# Altium schematic sheet 10_HDMI.SchDoc
size 812 x 508 mm; SheetNumber: 10; SheetTotal: 16
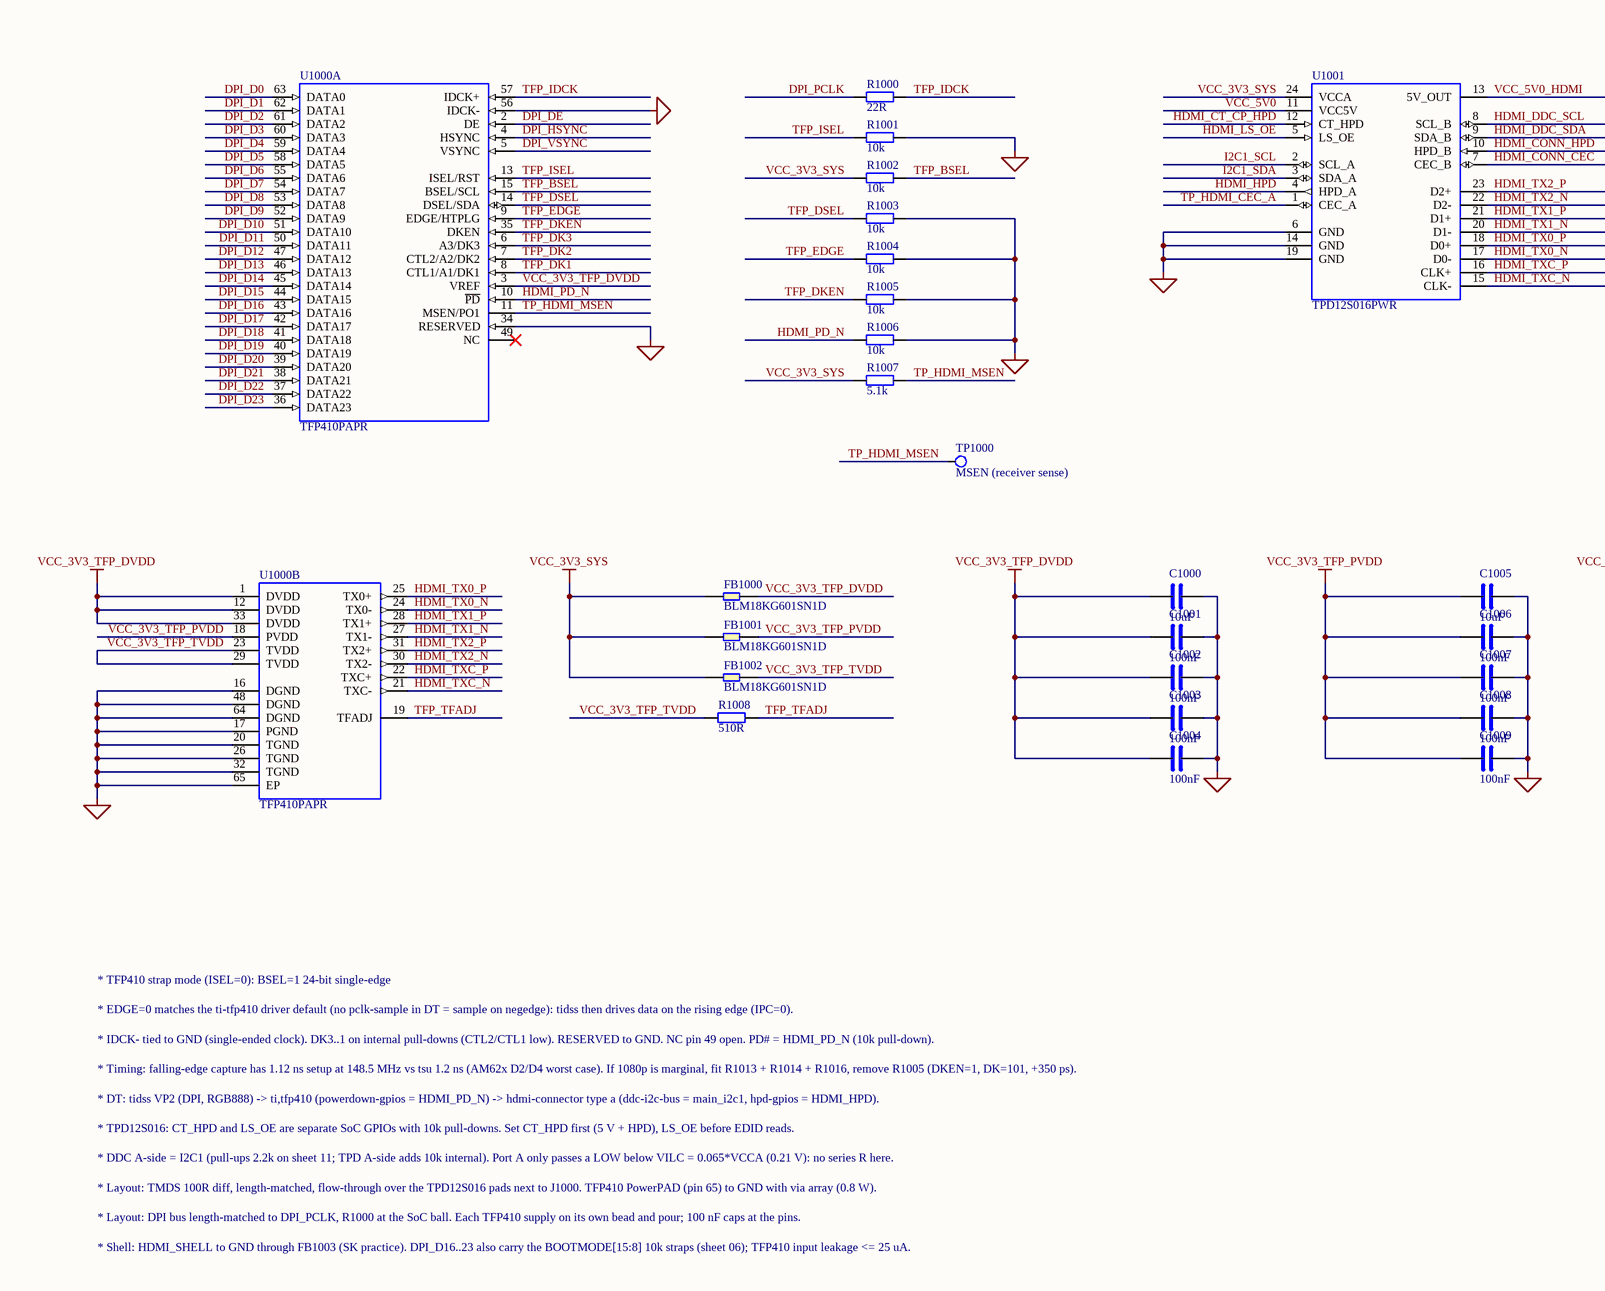
[diagram p0: 10_HDMI.SchDoc, left]
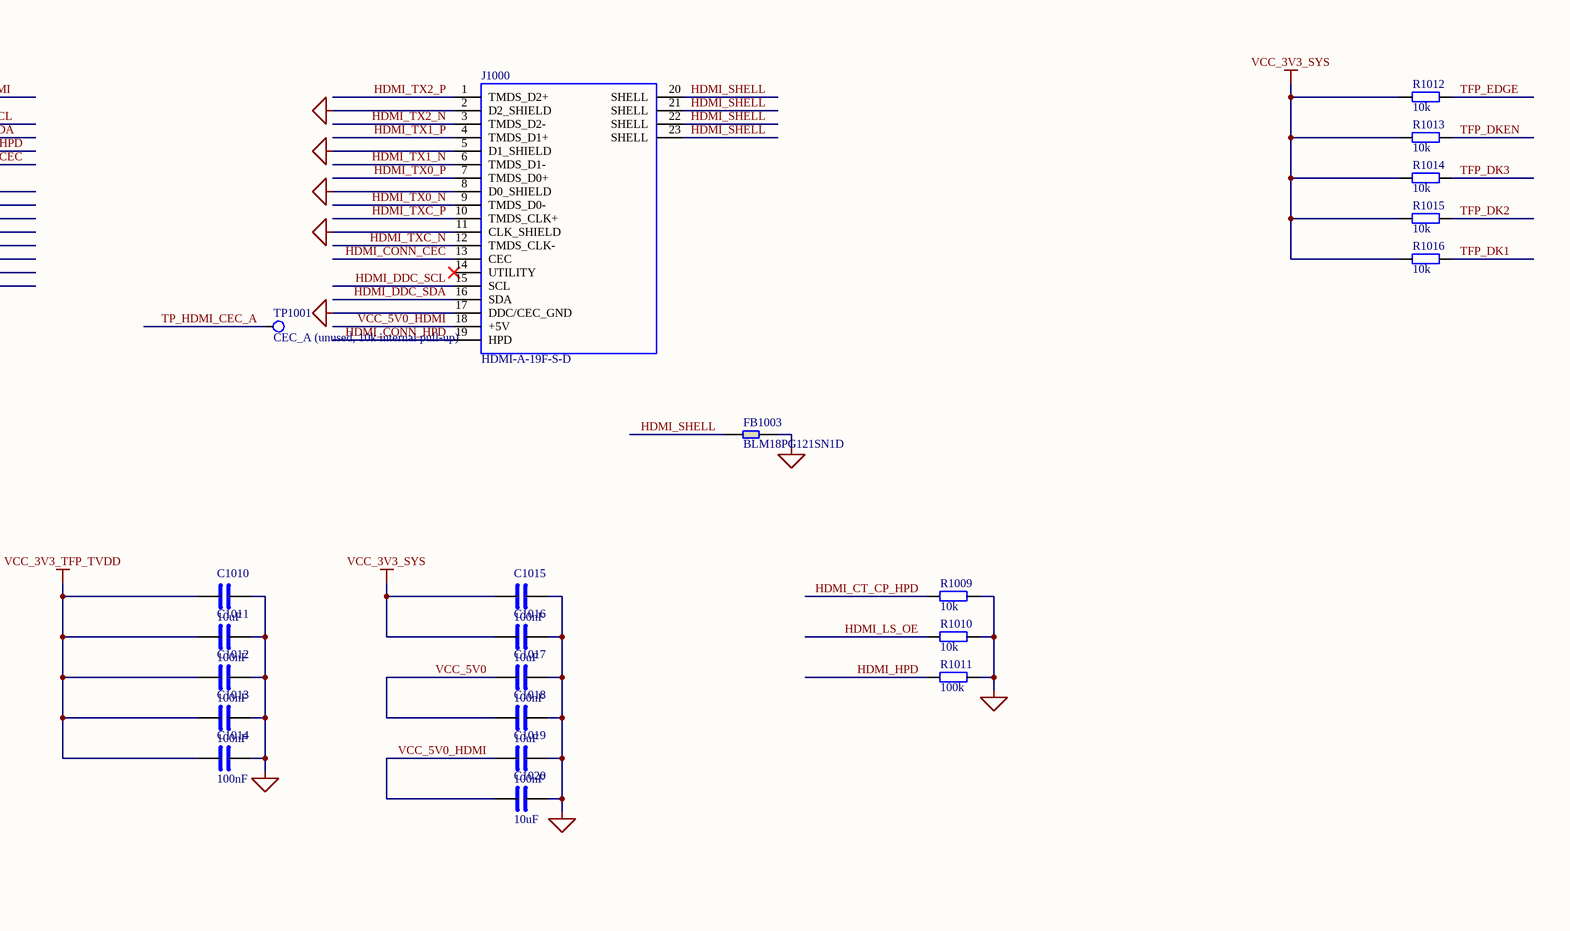
[diagram p1: 10_HDMI.SchDoc, right]

## Parts
C1000  10uF  [C0603]
C1001  100nF  [C0402]
C1002  100nF  [C0402]
C1003  100nF  [C0402]
C1004  100nF  [C0402]
C1005  10uF  [C0603]
C1006  100nF  [C0402]
C1007  100nF  [C0402]
C1008  100nF  [C0402]
C1009  100nF  [C0402]
C1010  10uF  [C0603]
C1011  100nF  [C0402]
C1012  100nF  [C0402]
C1013  100nF  [C0402]
C1014  100nF  [C0402]
C1015  100nF  [C0402]
C1016  10uF  [C0603]
C1017  100nF  [C0402]
C1018  10uF  [C0603]
C1019  100nF  [C0402]
C1020  10uF  [C0603]
FB1000  BLM18KG601SN1D  [FB0603]
FB1001  BLM18KG601SN1D  [FB0603]
FB1002  BLM18KG601SN1D  [FB0603]
FB1003  BLM18PG121SN1D  [FB0603]
J1000  HDMI-A-19F-S-D  [HDMI_A_XFCN_19F_S_D]
R1000  22R  [R0402]
R1001  10k  [R0402]
R1002  10k  [R0402]
R1003  10k  [R0402]
R1004  10k  [R0402]
R1005  10k  [R0402]
R1006  10k  [R0402]
R1007  5.1k  [R0402]
R1008  510R  [R0402]
R1009  10k  [R0402]
R1010  10k  [R0402]
R1011  100k  [R0402]
R1012  10k  [R0402]
R1013  10k  [R0402]
R1014  10k  [R0402]
R1015  10k  [R0402]
R1016  10k  [R0402]
TP1000  MSEN (receiver sense)  [TP_PAD_1.0]
TP1001  CEC_A (unused, 10k internal pull-up)  [TP_PAD_1.0]
U1000  TFP410PAPR  [HTQFP64_PAP_10X10]  (parts A,B of 2)
U1001  TPD12S016PWR  [TSSOP24_4.4X7.8_P0.65]

## Nets
GND: C1000.2 C1001.2 C1002.2 C1003.2 C1004.2 C1005.2 C1006.2 C1007.2 C1008.2 C1009.2 C1010.2 C1011.2 C1012.2 C1013.2 C1014.2 C1015.2 C1016.2 C1017.2 C1018.2 C1019.2 C1020.2 FB1003.2 J1000.2(D2_SHIELD) J1000.5(D1_SHIELD) J1000.8(D0_SHIELD) J1000.11(CLK_SHIELD) J1000.17(DDC/CEC_GND) R1001.2 R1003.2 R1004.2 R1005.2 R1006.2 R1009.2 R1010.2 R1011.2 U1000.16(DGND) U1000.17(PGND) U1000.20(TGND) U1000.26(TGND) U1000.32(TGND) U1000.34(RESERVED) U1000.48(DGND) U1000.56(IDCK-) U1000.64(DGND) U1000.65(EP) U1001.6(GND) U1001.14(GND) U1001.19(GND)
VCC_3V3_SYS: C1015.1 C1016.1 FB1000.1 FB1001.1 FB1002.1 R1002.1 R1007.1 R1012.1 R1013.1 R1014.1 R1015.1 R1016.1 U1001.24(VCCA)
VCC_3V3_TFP_DVDD: C1000.1 C1001.1 C1002.1 C1003.1 C1004.1 FB1000.2 U1000.1(DVDD) U1000.3(VREF) U1000.12(DVDD) U1000.33(DVDD)
VCC_3V3_TFP_PVDD: C1005.1 C1006.1 C1007.1 C1008.1 C1009.1 FB1001.2 U1000.18(PVDD)
VCC_3V3_TFP_TVDD: C1010.1 C1011.1 C1012.1 C1013.1 C1014.1 FB1002.2 R1008.1 U1000.23(TVDD) U1000.29(TVDD)
DPI_D0: U1000.63(DATA0)
DPI_D1: U1000.62(DATA1)
DPI_D2: U1000.61(DATA2)
DPI_D3: U1000.60(DATA3)
DPI_D4: U1000.59(DATA4)
DPI_D5: U1000.58(DATA5)
DPI_D6: U1000.55(DATA6)
DPI_D7: U1000.54(DATA7)
DPI_D8: U1000.53(DATA8)
DPI_D9: U1000.52(DATA9)
DPI_D10: U1000.51(DATA10)
DPI_D11: U1000.50(DATA11)
DPI_D12: U1000.47(DATA12)
DPI_D13: U1000.46(DATA13)
DPI_D14: U1000.45(DATA14)
DPI_D15: U1000.44(DATA15)
DPI_D16: U1000.43(DATA16)
DPI_D17: U1000.42(DATA17)
DPI_D18: U1000.41(DATA18)
DPI_D19: U1000.40(DATA19)
DPI_D20: U1000.39(DATA20)
DPI_D21: U1000.38(DATA21)
DPI_D22: U1000.37(DATA22)
DPI_D23: U1000.36(DATA23)
DPI_DE: U1000.2(DE)
DPI_HSYNC: U1000.4(HSYNC)
DPI_PCLK: R1000.1
DPI_VSYNC: U1000.5(VSYNC)
HDMI_CONN_CEC: J1000.13(CEC) U1001.7(CEC_B)
HDMI_CONN_HPD: J1000.19(HPD) U1001.10(HPD_B)
HDMI_CT_CP_HPD: R1009.1 U1001.12(CT_HPD)
HDMI_DDC_SCL: J1000.15(SCL) U1001.8(SCL_B)
HDMI_DDC_SDA: J1000.16(SDA) U1001.9(SDA_B)
HDMI_HPD: R1011.1 U1001.4(HPD_A)
HDMI_LS_OE: R1010.1 U1001.5(LS_OE)
HDMI_PD_N: R1006.1 U1000.10(~{PD})
HDMI_SHELL: FB1003.1 J1000.20(SHELL) J1000.21(SHELL) J1000.22(SHELL) J1000.23(SHELL)
HDMI_TX0_N: J1000.9(TMDS_D0-) U1000.24(TX0-) U1001.17(D0-)
HDMI_TX0_P: J1000.7(TMDS_D0+) U1000.25(TX0+) U1001.18(D0+)
HDMI_TX1_N: J1000.6(TMDS_D1-) U1000.27(TX1-) U1001.20(D1-)
HDMI_TX1_P: J1000.4(TMDS_D1+) U1000.28(TX1+) U1001.21(D1+)
HDMI_TX2_N: J1000.3(TMDS_D2-) U1000.30(TX2-) U1001.22(D2-)
HDMI_TX2_P: J1000.1(TMDS_D2+) U1000.31(TX2+) U1001.23(D2+)
HDMI_TXC_N: J1000.12(TMDS_CLK-) U1000.21(TXC-) U1001.15(CLK-)
HDMI_TXC_P: J1000.10(TMDS_CLK+) U1000.22(TXC+) U1001.16(CLK+)
I2C1_SCL: U1001.2(SCL_A)
I2C1_SDA: U1001.3(SDA_A)
TFP_BSEL: R1002.2 U1000.15(BSEL/SCL)
TFP_DK1: R1016.2 U1000.8(CTL1/A1/DK1)
TFP_DK2: R1015.2 U1000.7(CTL2/A2/DK2)
TFP_DK3: R1014.2 U1000.6(A3/DK3)
TFP_DKEN: R1005.1 R1013.2 U1000.35(DKEN)
TFP_DSEL: R1003.1 U1000.14(DSEL/SDA)
TFP_EDGE: R1004.1 R1012.2 U1000.9(EDGE/HTPLG)
TFP_IDCK: R1000.2 U1000.57(IDCK+)
TFP_ISEL: R1001.1 U1000.13(ISEL/RST)
TFP_TFADJ: R1008.2 U1000.19(TFADJ)
TP_HDMI_CEC_A: TP1001.1(TP) U1001.1(CEC_A)
TP_HDMI_MSEN: R1007.2 TP1000.1(TP) U1000.11(MSEN/PO1)
VCC_5V0: C1017.1 C1018.1 U1001.11(VCC5V)
VCC_5V0_HDMI: C1019.1 C1020.1 J1000.18(+5V) U1001.13(5V_OUT)

Not connected (* = marked no-connect by the designer): J1000 14(UTILITY)*; U1000 49(NC)*

## Notes on the sheet
- * TFP410 strap mode (ISEL=0): BSEL=1 24-bit single-edge
- * EDGE=0 matches the ti-tfp410 driver default (no pclk-sample in DT = sample on negedge): tidss then drives data on the rising edge (IPC=0).
- * IDCK- tied to GND (single-ended clock). DK3..1 on internal pull-downs (CTL2/CTL1 low). RESERVED to GND. NC pin 49 open. PD# = HDMI_PD_N (10k pull-down).
- * Timing: falling-edge capture has 1.12 ns setup at 148.5 MHz vs tsu 1.2 ns (AM62x D2/D4 worst case). If 1080p is marginal, fit R1013 + R1014 + R1016, remove R1005 (DKEN=1, DK=101, +350 ps).
- * DT: tidss VP2 (DPI, RGB888) -> ti,tfp410 (powerdown-gpios = HDMI_PD_N) -> hdmi-connector type a (ddc-i2c-bus = main_i2c1, hpd-gpios = HDMI_HPD).
- * TPD12S016: CT_HPD and LS_OE are separate SoC GPIOs with 10k pull-downs. Set CT_HPD first (5 V + HPD), LS_OE before EDID reads.
- * DDC A-side = I2C1 (pull-ups 2.2k on sheet 11; TPD A-side adds 10k internal). Port A only passes a LOW below VILC = 0.065*VCCA (0.21 V): no series R here.
- * Layout: TMDS 100R diff, length-matched, flow-through over the TPD12S016 pads next to J1000. TFP410 PowerPAD (pin 65) to GND with via array (0.8 W).
- * Layout: DPI bus length-matched to DPI_PCLK, R1000 at the SoC ball. Each TFP410 supply on its own bead and pour; 100 nF caps at the pins.
- * Shell: HDMI_SHELL to GND through FB1003 (SK practice). DPI_D16..23 also carry the BOOTMODE[15:8] 10k straps (sheet 06); TFP410 input leakage <= 25 uA.

## Library data of the parts
C1000 = CAP: Capacitor, non-polarized; Spec: 10uF 10V X5R 0603 (DVDD pins 1/12/33)
C1001-C1004 = CAP: Capacitor, non-polarized; Spec: 100nF 16V X7R 0402 (DVDD pins 1/12/33)
C1005 = CAP: Capacitor, non-polarized; Spec: 10uF 10V X5R 0603 (PVDD pin 18)
C1006-C1009 = CAP: Capacitor, non-polarized; Spec: 100nF 16V X7R 0402 (PVDD pin 18)
C1010 = CAP: Capacitor, non-polarized; Spec: 10uF 10V X5R 0603 (TVDD pins 23/29)
C1011-C1014 = CAP: Capacitor, non-polarized; Spec: 100nF 16V X7R 0402 (TVDD pins 23/29)
C1015 = CAP: Capacitor, non-polarized; Spec: 100nF 16V X7R 0402 (TPD VCCA)
C1016 = CAP: Capacitor, non-polarized; Spec: 10uF 10V X5R 0603 (TPD VCCA bulk, SK)
C1017 = CAP: Capacitor, non-polarized; Spec: 100nF 16V X7R 0402 (TPD VCC5V)
C1018 = CAP: Capacitor, non-polarized; Spec: 10uF 10V X5R 0603 (TPD VCC5V bulk, SK)
C1019 = CAP: Capacitor, non-polarized; Spec: 100nF 16V X7R 0402 (5V_OUT)
C1020 = CAP: Capacitor, non-polarized; Spec: 10uF 10V X5R 0603 (5V_OUT bulk, SK)
FB1000 = FERRITE: Ferrite bead; Manufacturer: Murata; Spec: BLM18KG601SN1D 600R@100MHz 1.3A 0603 (DVDD); MPN: BLM18KG601SN1D
FB1001 = FERRITE: Ferrite bead; Manufacturer: Murata; Spec: BLM18KG601SN1D 600R@100MHz 1.3A 0603 (PVDD); MPN: BLM18KG601SN1D
FB1002 = FERRITE: Ferrite bead; Manufacturer: Murata; Spec: BLM18KG601SN1D 600R@100MHz 1.3A 0603 (TVDD); MPN: BLM18KG601SN1D
FB1003 = FERRITE: Ferrite bead; Manufacturer: Murata; Spec: BLM18PG121SN1D 120R@100MHz 0603 (shell to GND, SK FL17); MPN: BLM18PG121SN1D
J1000 = HDMI_A_RECEPT: HDMI type-A receptacle, 19 pin + shell (XFCN HDMI-A-19F-S-D); MPN: HDMI-A-19F-S-D; Manufacturer: XFCN
R1000 = RES: Resistor; Spec: 22R 0402 (IDCK series, place at SoC ball T26)
R1001 = RES: Resistor; Spec: 10k 0402 (ISEL=0: I2C off, strap mode)
R1002 = RES: Resistor; Spec: 10k 0402 (BSEL=1: 24-bit single edge)
R1003 = RES: Resistor; Spec: 10k 0402 (DSEL=0: don't care at VREF=DVDD)
R1004 = RES: Resistor; Spec: 10k 0402 (EDGE=0: latch on IDCK falling edge)
R1005 = RES: Resistor; Spec: 10k 0402 (DKEN=0: de-skew off)
R1006 = RES: Resistor; Spec: 10k 0402 (TFP410 powered down in reset)
R1007 = RES: Resistor; Spec: 5.1k 0402 (MSEN open-drain pull-up, DS: 5k)
R1008 = RES: Resistor; Spec: 510R 1% 0402 (RTFADJ: 500 mV DVI swing)
R1009 = RES: Resistor; Spec: 10k 0402 (5 V switch + HPD off in reset)
R1010 = RES: Resistor; Spec: 10k 0402 (DDC level shifter off in reset)
R1011 = RES: Resistor; Spec: 100k 0402 (defines HPD while CT_HPD = 0)
R1012 = RES: Resistor; DNP: 1; Spec: 10k 0402 DNP (EDGE=1 option; remove R1004)
R1013 = RES: Resistor; DNP: 1; Spec: 10k 0402 DNP (DKEN=1 option; remove R1005)
R1014 = RES: Resistor; DNP: 1; Spec: 10k 0402 DNP (DK3=1)
R1015 = RES: Resistor; DNP: 1; Spec: 10k 0402 DNP (DK2=1)
R1016 = RES: Resistor; DNP: 1; Spec: 10k 0402 DNP (DK1=1)
TP1000 TP1001 = TESTPOINT: Test point
U1000 = TFP410_PAP: TI TFP410 DVI 1.0 transmitter, 24-bit DPI in, HTQFP-64 PowerPAD; Manufacturer: Texas Instruments; MPN: TFP410PAPR
U1001 = TPD12S016_PW: TI TPD12S016 HDMI companion: 5 V load switch, DDC/CEC/HPD level shift, 12-ch ESD, TSSOP-24; Manufacturer: Texas Instruments; MPN: TPD12S016PWR